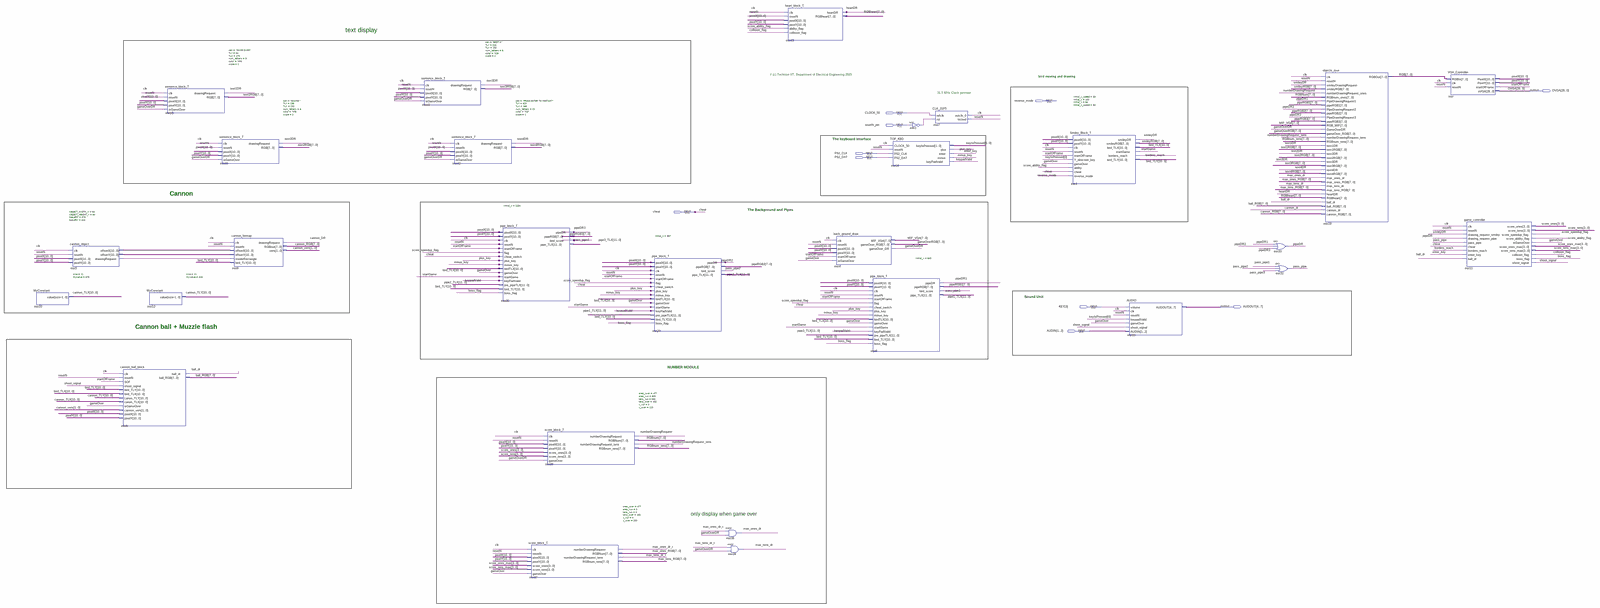
[diagram p0: schematic sheet, whole]
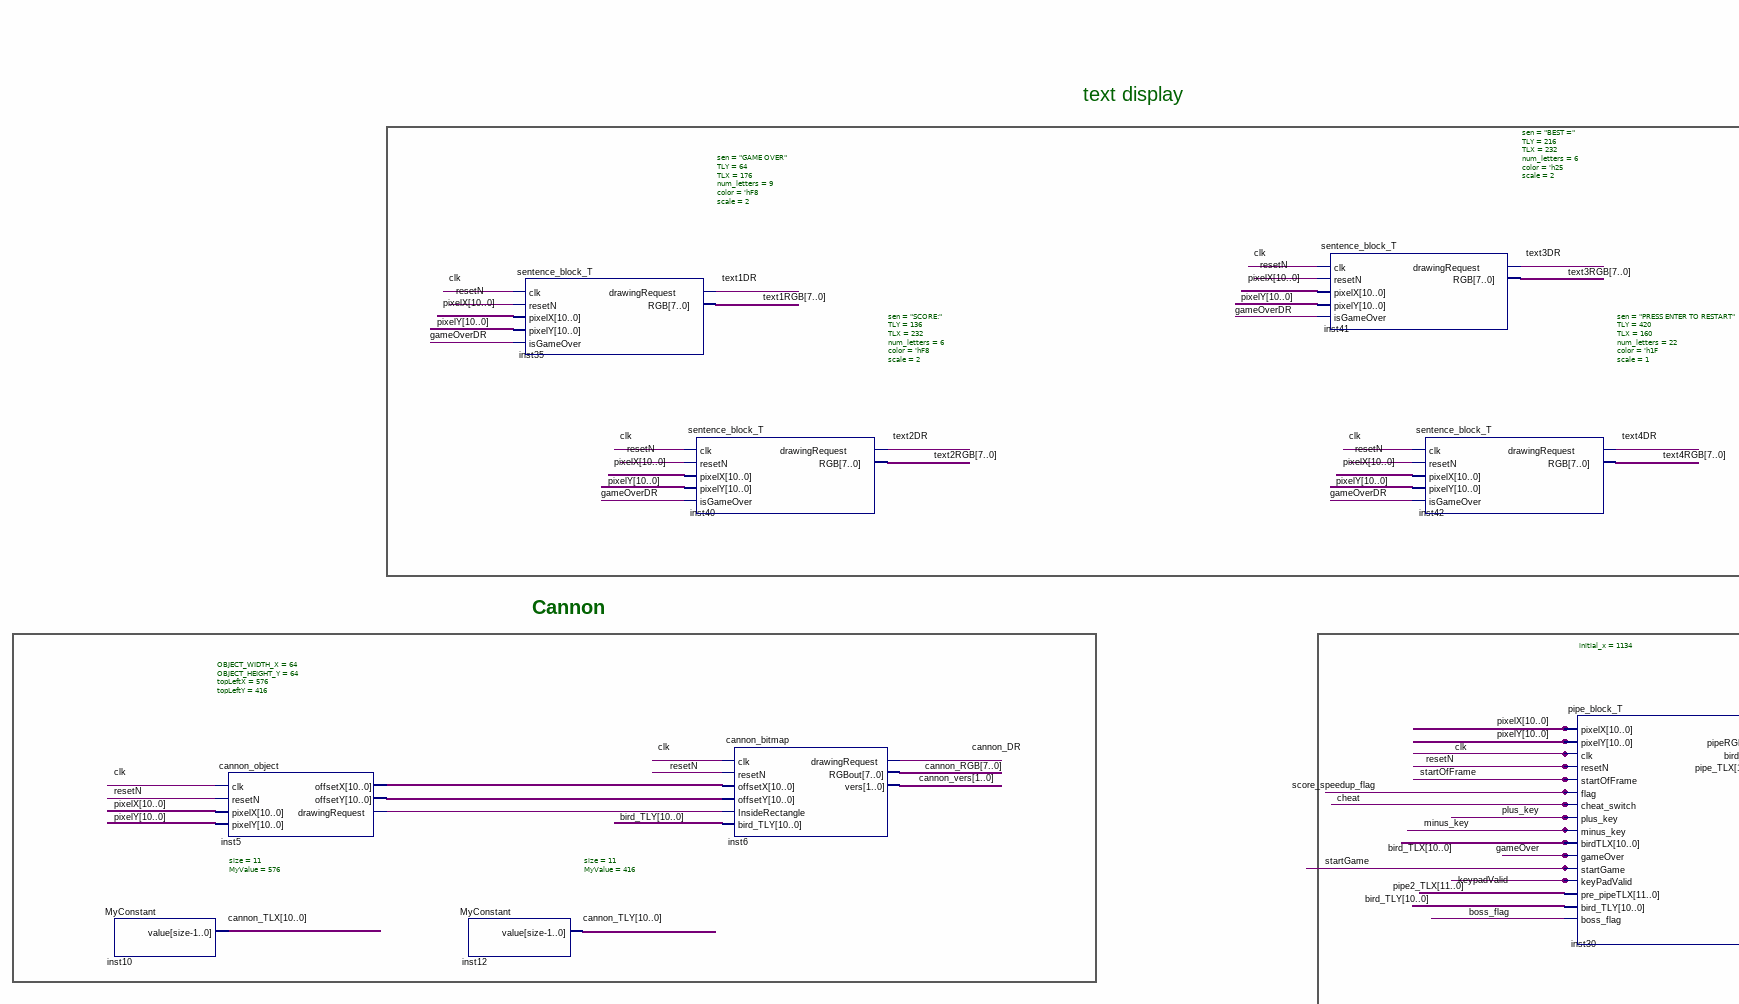
[diagram p1: schematic sheet, upper left part]
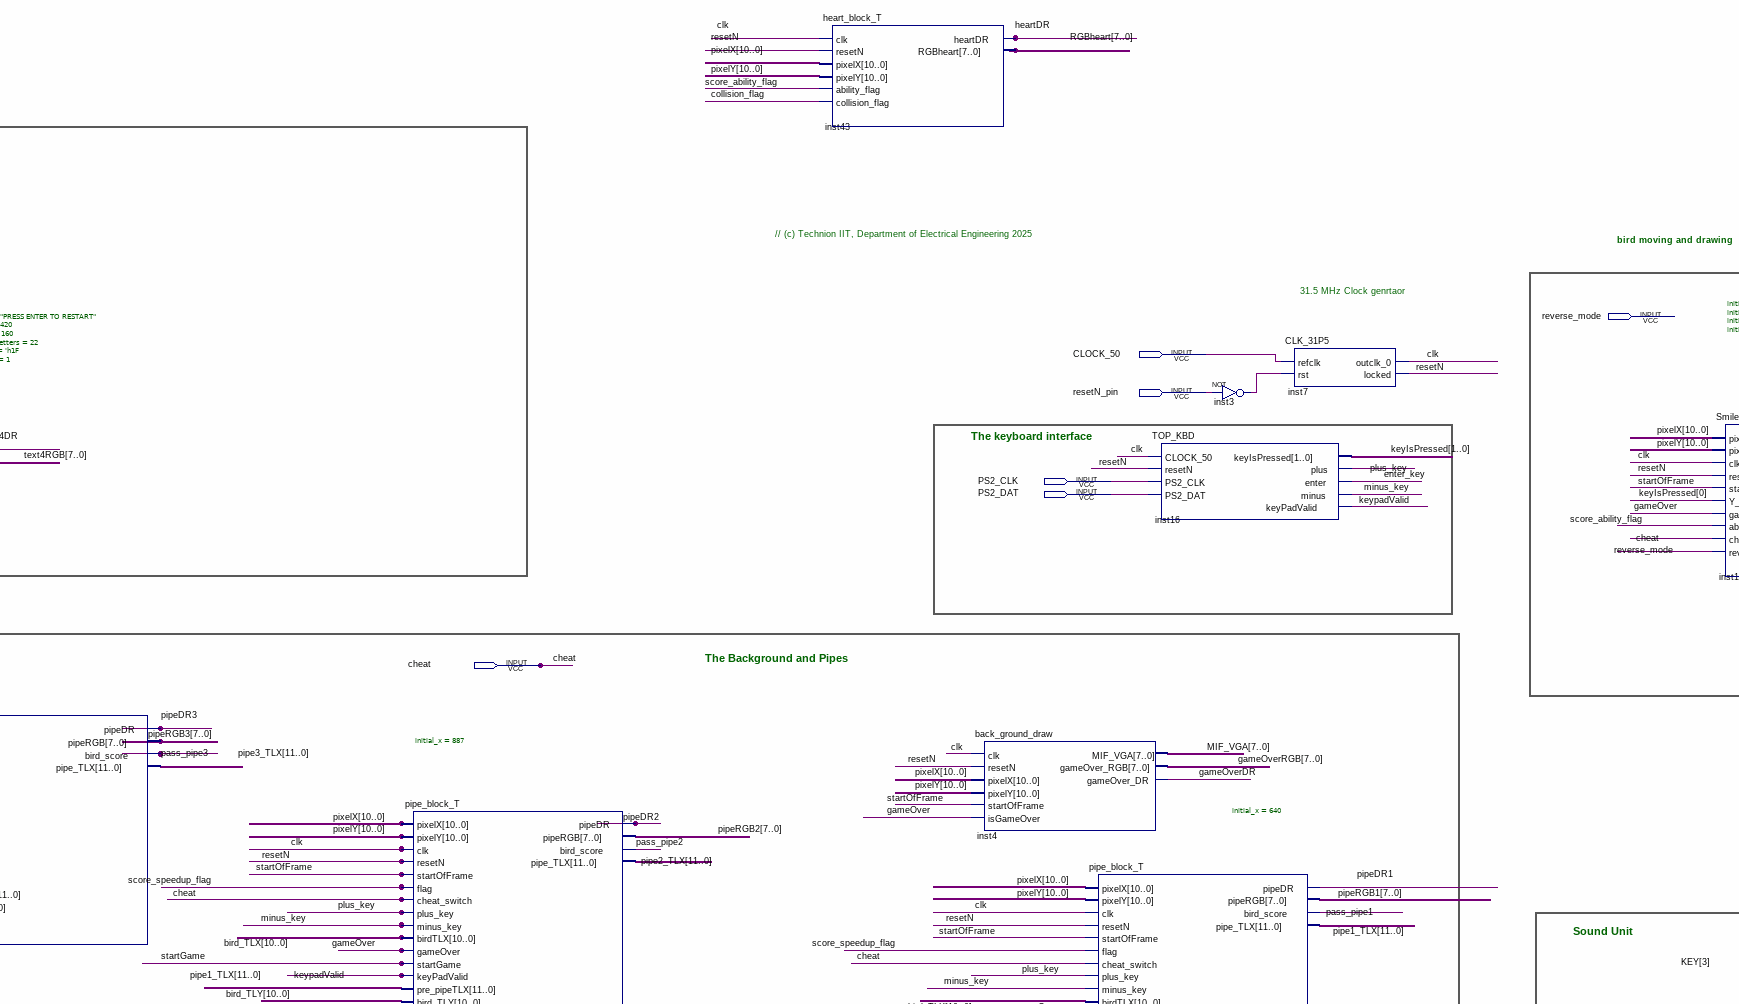
[diagram p2: schematic sheet, upper centre part]
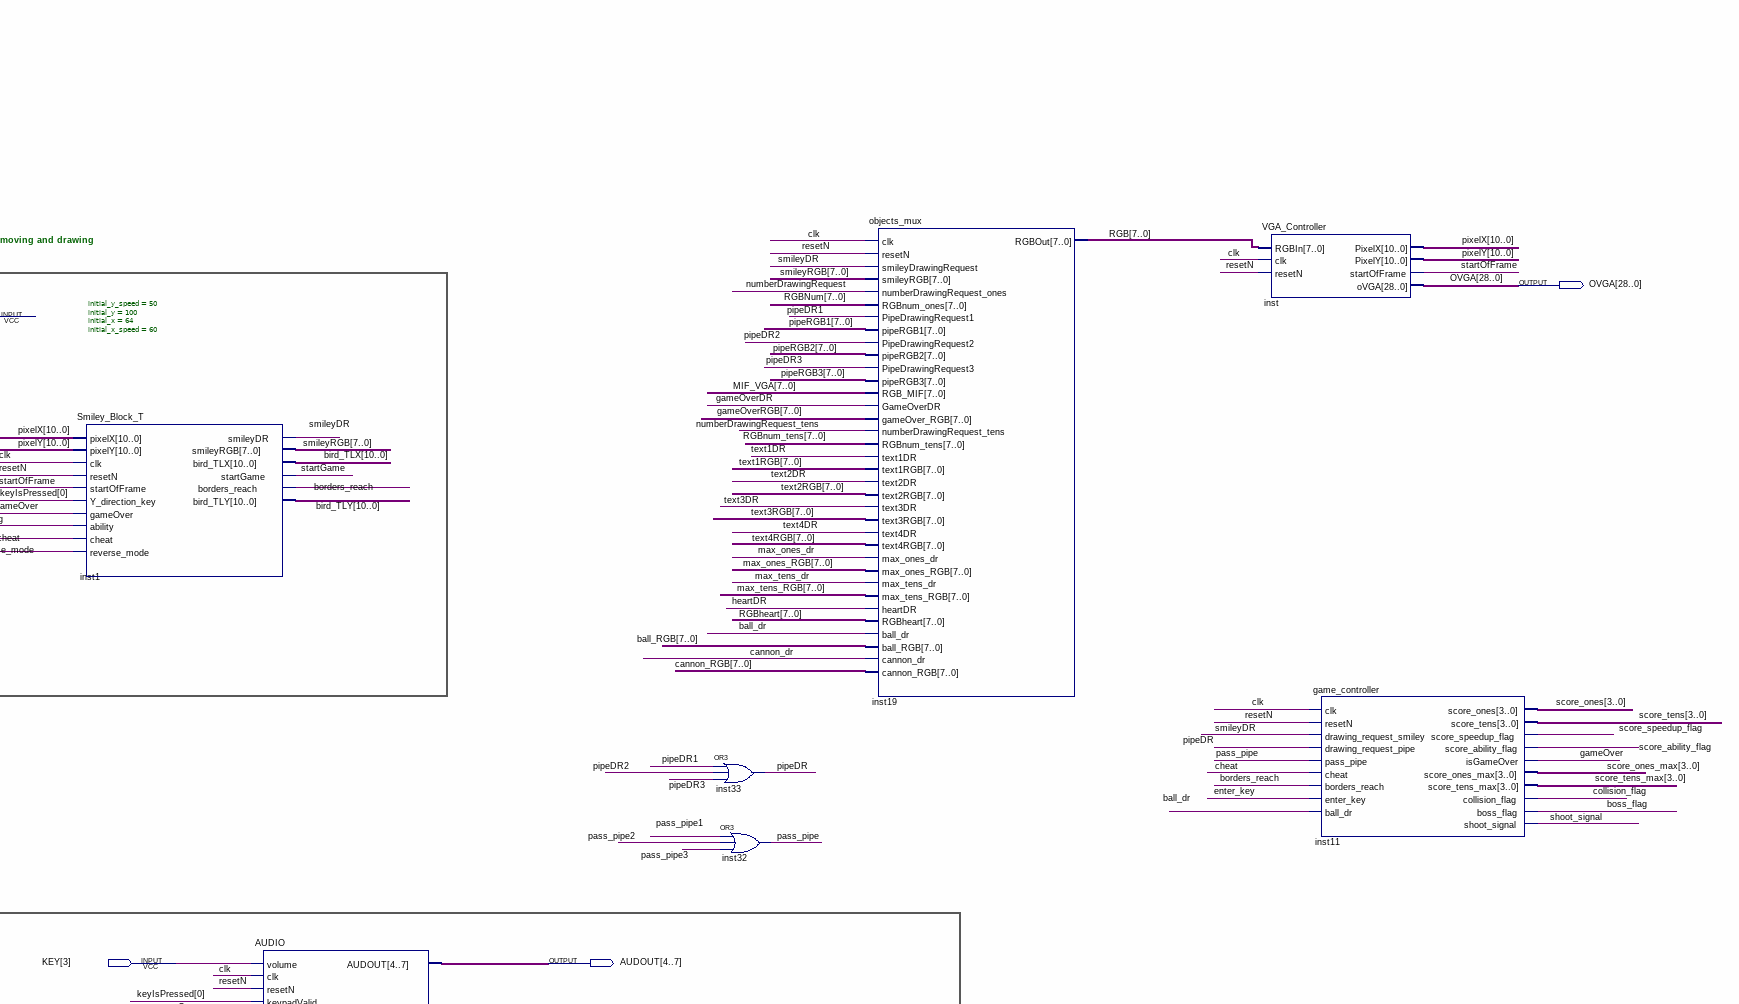
[diagram p3: schematic sheet, upper right part]
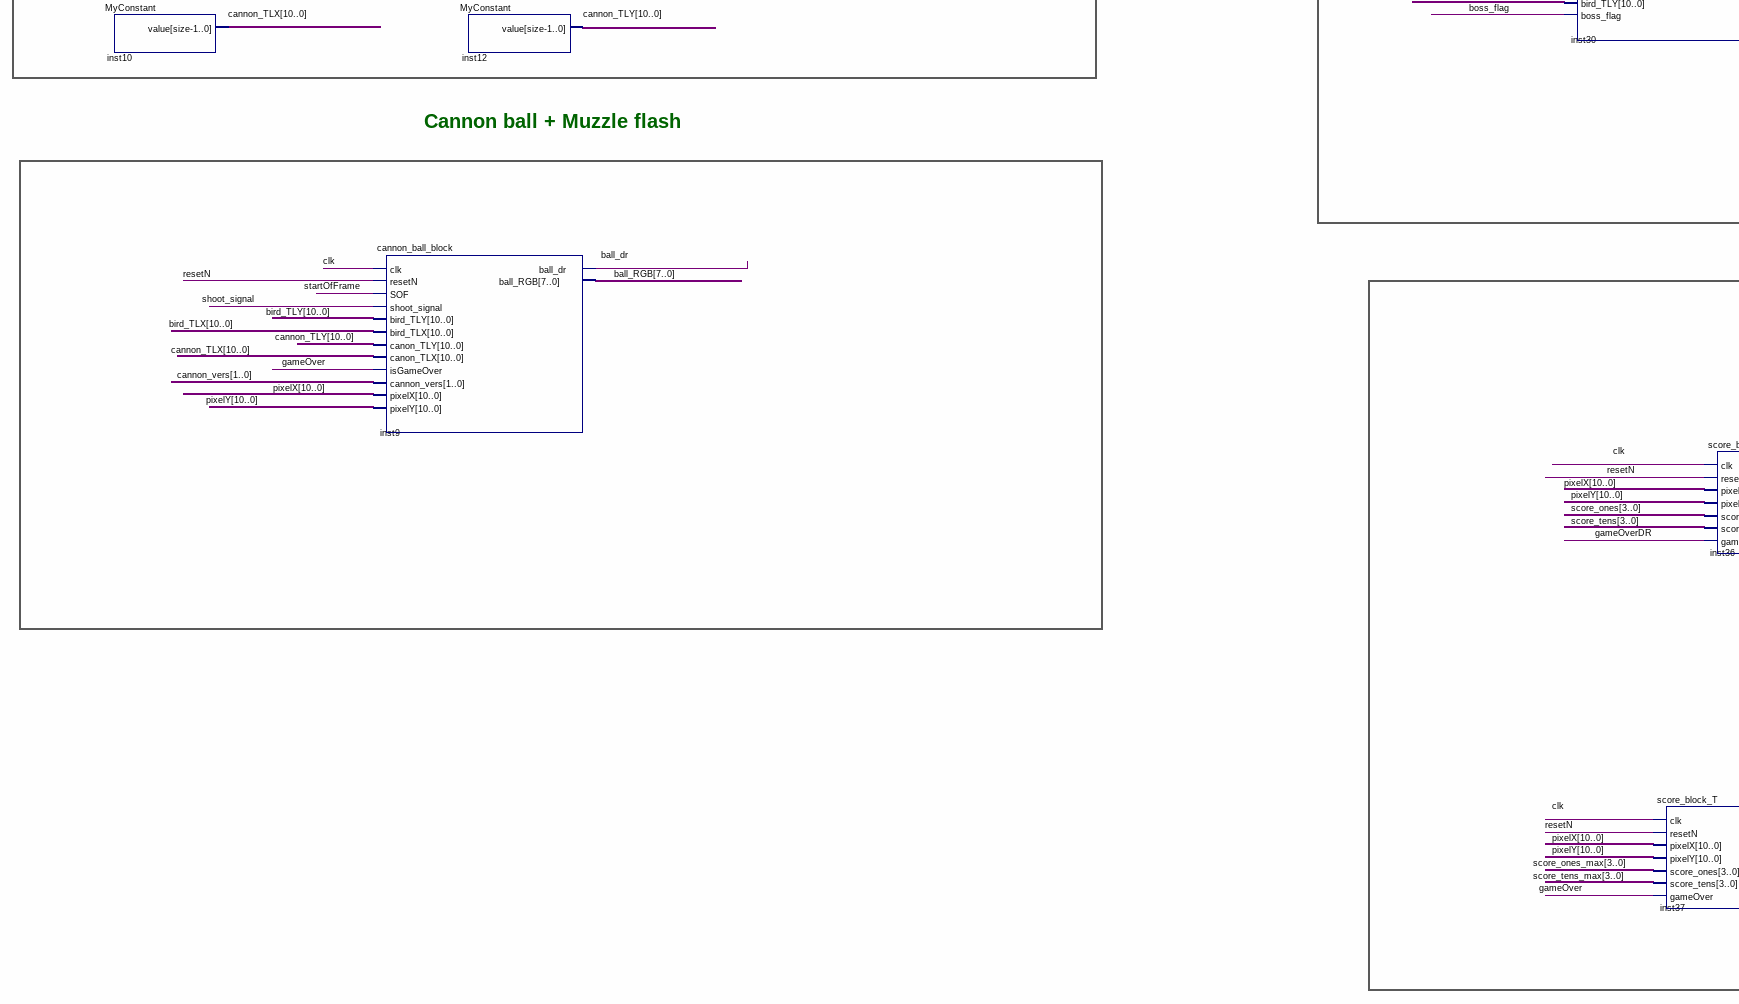
[diagram p4: schematic sheet, lower left part]
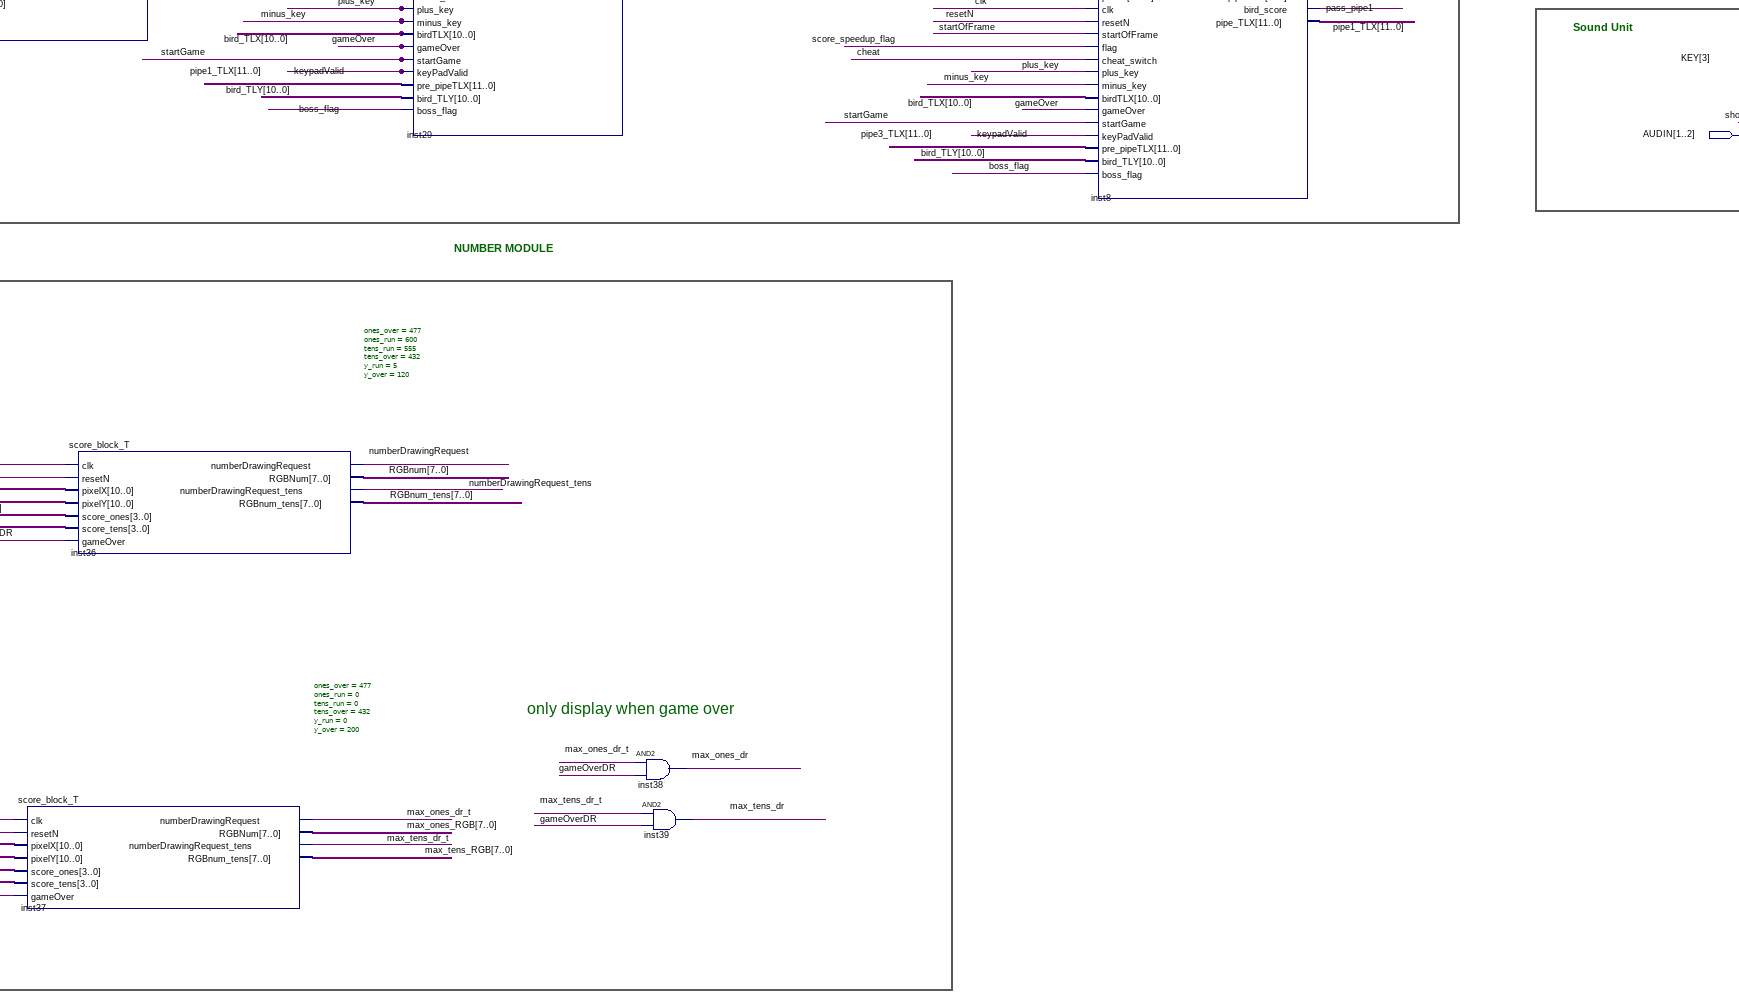
[diagram p5: schematic sheet, lower centre part]
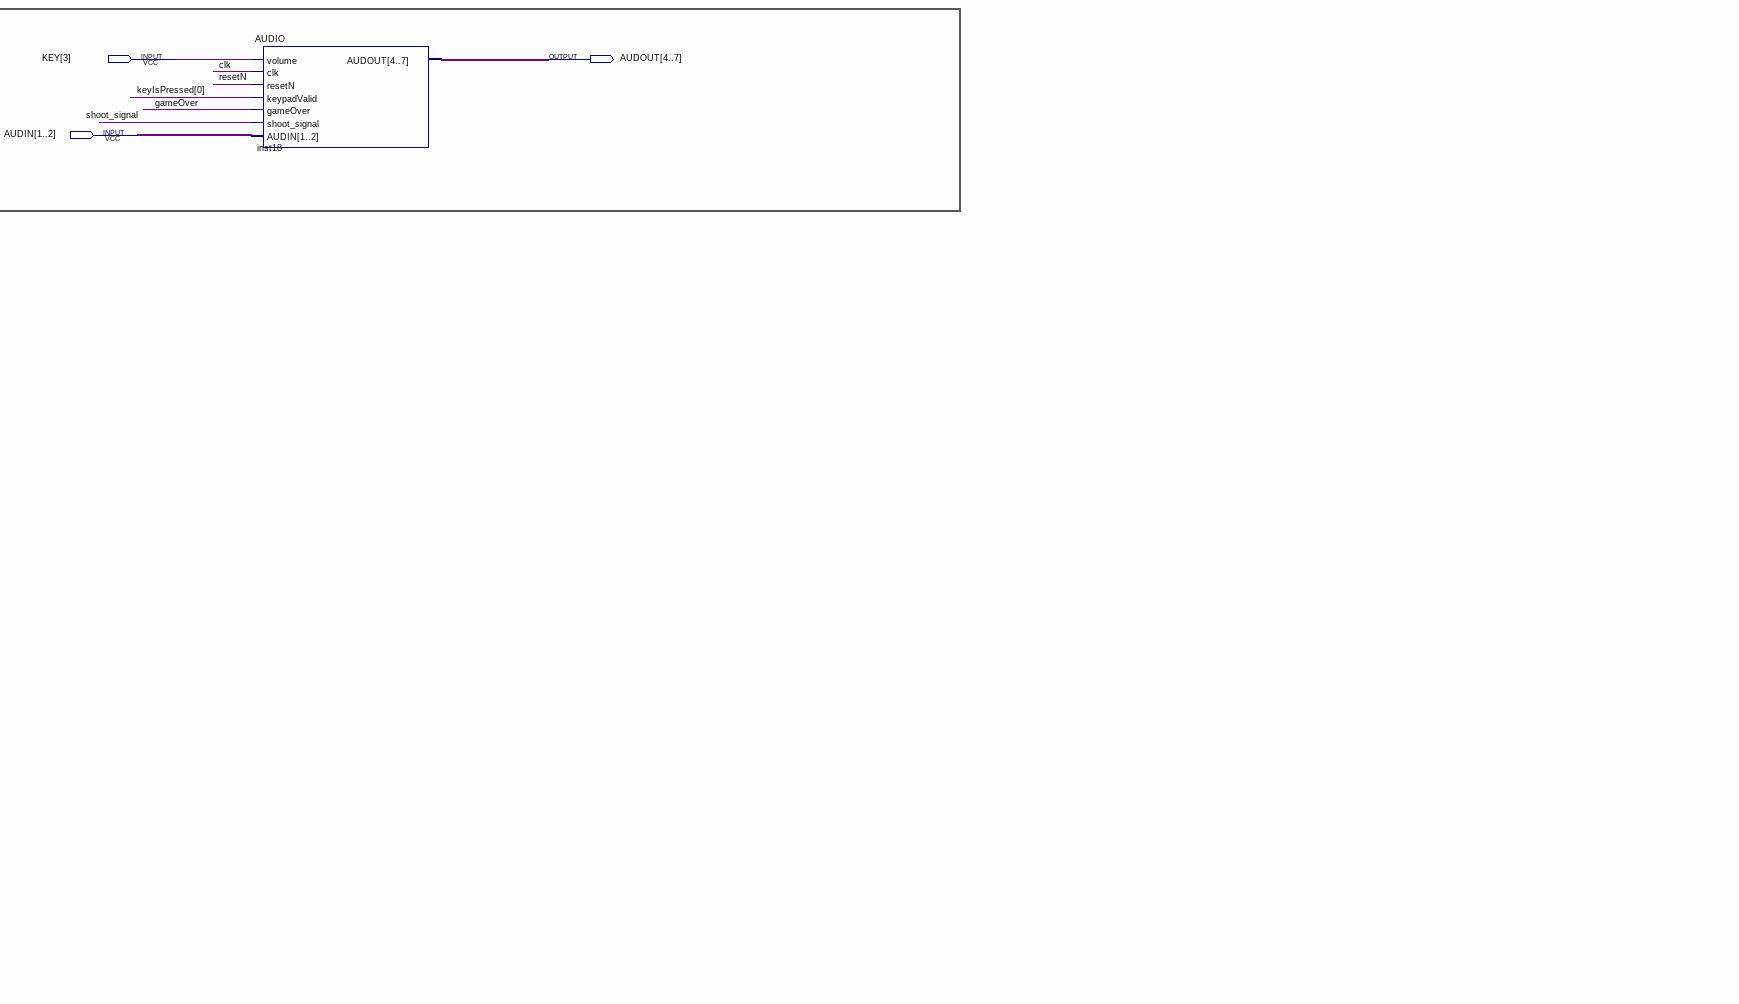
[diagram p6: schematic sheet, lower right part]
// Quartus schematic TOP_VGA_DEMO.bdf as structural Verilog: 28 symbols, 10 pins
module TOP_VGA_DEMO (
  input  reverse_mode,
  input  CLOCK_50,
  input  resetN_pin,
  input  PS2_CLK,
  input  PS2_DAT,
  input  cheat,
  input  [3:3] KEY,
  input  [1:2] AUDIN,
  output [28:0] OVGA,
  output [4:7] AUDOUT
);

  wire ball_dr, borders_reach, boss_flag, cannon_DR, clk, collision_flag, enter_key, gameOver, gameOverDR,
       heartDR, inst3_out, inst5_drawingrequest, keypadValid, max_ones_dr, max_ones_dr_t, max_tens_dr,
       max_tens_dr_t, minus_key, numberDrawingRequest, numberDrawingRequest_tens, pass_pipe, pass_pipe1,
       pass_pipe2, pass_pipe3, pipeDR, pipeDR1, pipeDR2, pipeDR3, plus_key, resetN, score_ability_flag,
       score_speedup_flag, shoot_signal, smileyDR, startGame, startOfFrame, text1DR, text2DR, text3DR,
       text4DR;
  wire [1:0] cannon_vers, keyIsPressed;
  wire [3:0] score_ones, score_ones_max, score_tens, score_tens_max;
  wire [7:0] ball_RGB, cannon_RGB, gameOverRGB, max_ones_RGB, max_tens_RGB, MIF_VGA, pipeRGB1, pipeRGB2,
       pipeRGB3, RGB, RGBheart, RGBnum, RGBnum_tens, smileyRGB, text1RGB, text2RGB, text3RGB, text4RGB;
  wire [10:0] bird_TLX, bird_TLY, cannon_TLX, cannon_TLY, inst5_offsetx, inst5_offsety, pixelX, pixelY;
  wire [11:0] pipe1_TLX, pipe2_TLX, pipe3_TLX;

  MyConstant #(.size(11), .MyValue(576)) inst10 (.value(cannon_TLX));
  cannon_object #(.OBJECT_WIDTH_X(64), .OBJECT_HEIGHT_Y(64), .topLeftX(576), .topLeftY(416)) inst5 (
    .clk(clk), .resetN(resetN), .pixelX(pixelX), .pixelY(pixelY), .offsetX(inst5_offsetx),
    .offsetY(inst5_offsety), .drawingRequest(inst5_drawingrequest));
  cannon_ball_block inst9 (
    .clk(clk), .resetN(resetN), .SOF(startOfFrame), .shoot_signal(shoot_signal), .bird_TLY(bird_TLY),
    .bird_TLX(bird_TLX), .canon_TLY(cannon_TLY), .canon_TLX(cannon_TLX), .isGameOver(gameOver),
    .cannon_vers(cannon_vers), .pixelX(pixelX), .pixelY(pixelY), .ball_dr(ball_dr), .ball_RGB(ball_RGB));
  MyConstant #(.size(11), .MyValue(416)) inst12 (.value(cannon_TLY));
  sentence_block_T #(.sen("GAME OVER"), .TLY(64), .TLX(176), .num_letters(9), .color('hF8), .scale(2)) inst35 (
    .clk(clk), .resetN(resetN), .pixelX(pixelX), .pixelY(pixelY), .isGameOver(gameOverDR),
    .drawingRequest(text1DR), .RGB(text1RGB));
  sentence_block_T #(.sen("SCORE:"), .TLY(136), .TLX(232), .num_letters(6), .color('hF8), .scale(2)) inst40 (
    .clk(clk), .resetN(resetN), .pixelX(pixelX), .pixelY(pixelY), .isGameOver(gameOverDR),
    .drawingRequest(text2DR), .RGB(text2RGB));
  cannon_bitmap inst6 (
    .clk(clk), .resetN(resetN), .offsetX(inst5_offsetx), .offsetY(inst5_offsety),
    .InsideRectangle(inst5_drawingrequest), .bird_TLY(bird_TLY), .drawingRequest(cannon_DR),
    .RGBout(cannon_RGB), .vers(cannon_vers));
  sentence_block_T #(.sen("BEST ="), .TLY(216), .TLX(232), .num_letters(6), .color('h25), .scale(2)) inst41 (
    .clk(clk), .resetN(resetN), .pixelX(pixelX), .pixelY(pixelY), .isGameOver(gameOverDR),
    .drawingRequest(text3DR), .RGB(text3RGB));
  sentence_block_T #(.sen("PRESS ENTER TO RESTART"), .TLY(420), .TLX(160), .num_letters(22), .color('h1F), .scale(1)) inst42 (
    .clk(clk), .resetN(resetN), .pixelX(pixelX), .pixelY(pixelY), .isGameOver(gameOverDR),
    .drawingRequest(text4DR), .RGB(text4RGB));
  pipe_block_T #(.initial_x(1134)) inst30 (
    .pixelX(pixelX), .pixelY(pixelY), .clk(clk), .resetN(resetN), .startOfFrame(startOfFrame),
    .flag(score_speedup_flag), .cheat_switch(cheat), .plus_key(plus_key), .minus_key(minus_key),
    .birdTLX(bird_TLX), .gameOver(gameOver), .startGame(startGame), .keyPadValid(keypadValid),
    .pre_pipeTLX(pipe2_TLX), .bird_TLY(bird_TLY), .boss_flag(boss_flag), .pipeDR(pipeDR3),
    .pipeRGB(pipeRGB3), .bird_score(pass_pipe3), .pipe_TLX(pipe3_TLX));
  score_block_T #(.ones_over(477), .ones_run(0), .tens_run(0), .tens_over(432), .y_run(0), .y_over(200)) inst37 (
    .clk(clk), .resetN(resetN), .pixelX(pixelX), .pixelY(pixelY), .score_ones(score_ones_max),
    .score_tens(score_tens_max), .gameOver(gameOver), .numberDrawingRequest(max_ones_dr_t),
    .RGBNum(max_ones_RGB), .numberDrawingRequest_tens(max_tens_dr_t), .RGBnum_tens(max_tens_RGB));
  score_block_T #(.ones_over(477), .ones_run(600), .tens_run(555), .tens_over(432), .y_run(5), .y_over(120)) inst36 (
    .clk(clk), .resetN(resetN), .pixelX(pixelX), .pixelY(pixelY), .score_ones(score_ones),
    .score_tens(score_tens), .gameOver(gameOverDR), .numberDrawingRequest(numberDrawingRequest),
    .RGBNum(RGBnum), .numberDrawingRequest_tens(numberDrawingRequest_tens), .RGBnum_tens(RGBnum_tens));
  pipe_block_T #(.initial_x(887)) inst29 (
    .pixelX(pixelX), .pixelY(pixelY), .clk(clk), .resetN(resetN), .startOfFrame(startOfFrame),
    .flag(score_speedup_flag), .cheat_switch(cheat), .plus_key(plus_key), .minus_key(minus_key),
    .birdTLX(bird_TLX), .gameOver(gameOver), .startGame(startGame), .keyPadValid(keypadValid),
    .pre_pipeTLX(pipe1_TLX), .bird_TLY(bird_TLY), .boss_flag(boss_flag), .pipeDR(pipeDR2),
    .pipeRGB(pipeRGB2), .bird_score(pass_pipe2), .pipe_TLX(pipe2_TLX));
  and inst38 (max_ones_dr, max_ones_dr_t, gameOverDR);
  and inst39 (max_tens_dr, max_tens_dr_t, gameOverDR);
  heart_block_T inst43 (
    .clk(clk), .resetN(resetN), .pixelX(pixelX), .pixelY(pixelY), .ability_flag(score_ability_flag),
    .collision_flag(collision_flag), .heartDR(heartDR), .RGBheart(RGBheart));
  back_ground_draw inst4 (
    .clk(clk), .resetN(resetN), .pixelX(pixelX), .pixelY(pixelY), .startOfFrame(startOfFrame),
    .isGameOver(gameOver), .MIF_VGA(MIF_VGA), .gameOver_RGB(gameOverRGB), .gameOver_DR(gameOverDR));
  pipe_block_T #(.initial_x(640)) inst8 (
    .pixelX(pixelX), .pixelY(pixelY), .clk(clk), .resetN(resetN), .startOfFrame(startOfFrame),
    .flag(score_speedup_flag), .cheat_switch(cheat), .plus_key(plus_key), .minus_key(minus_key),
    .birdTLX(bird_TLX), .gameOver(gameOver), .startGame(startGame), .keyPadValid(keypadValid),
    .pre_pipeTLX(pipe3_TLX), .bird_TLY(bird_TLY), .boss_flag(boss_flag), .pipeDR(pipeDR1),
    .pipeRGB(pipeRGB1), .bird_score(pass_pipe1), .pipe_TLX(pipe1_TLX));
  TOP_KBD inst16 (
    .CLOCK_50(clk), .resetN(resetN), .PS2_CLK(PS2_CLK), .PS2_DAT(PS2_DAT), .keyIsPressed(keyIsPressed),
    .plus(plus_key), .enter(enter_key), .minus(minus_key), .keyPadValid(keypadValid));
  not inst3 (inst3_out, resetN_pin);
  CLK_31P5 inst7 (.refclk(CLOCK_50), .rst(inst3_out), .outclk_0(clk), .locked(resetN));
  Smiley_Block_T #(.initial_y_speed(50), .initial_y(100), .initial_x(64), .initial_x_speed(60)) inst1 (
    .pixelX(pixelX), .pixelY(pixelY), .clk(clk), .resetN(resetN), .startOfFrame(startOfFrame),
    .Y_direction_key(keyIsPressed[0]), .gameOver(gameOver), .ability(score_ability_flag), .cheat(cheat),
    .reverse_mode(reverse_mode), .smileyDR(smileyDR), .smileyRGB(smileyRGB), .bird_TLX(bird_TLX),
    .startGame(startGame), .borders_reach(borders_reach), .bird_TLY(bird_TLY));
  AUDIO inst18 (
    .volume(KEY[3]), .clk(clk), .resetN(resetN), .keypadValid(keyIsPressed[0]), .gameOver(gameOver),
    .shoot_signal(shoot_signal), .AUDIN(AUDIN), .AUDOUT(AUDOUT));
  or inst33 (pipeDR, pipeDR1, pipeDR2, pipeDR3);
  or inst32 (pass_pipe, pass_pipe1, pass_pipe2, pass_pipe3);
  objects_mux inst19 (
    .clk(clk), .resetN(resetN), .smileyDrawingRequest(smileyDR), .smileyRGB(smileyRGB),
    .numberDrawingRequest_ones(numberDrawingRequest), .RGBnum_ones(RGBnum), .PipeDrawingRequest1(pipeDR1),
    .pipeRGB1(pipeRGB1), .PipeDrawingRequest2(pipeDR2), .pipeRGB2(pipeRGB2), .PipeDrawingRequest3(pipeDR3),
    .pipeRGB3(pipeRGB3), .RGB_MIF(MIF_VGA), .GameOverDR(gameOverDR), .gameOver_RGB(gameOverRGB),
    .numberDrawingRequest_tens(numberDrawingRequest_tens), .RGBnum_tens(RGBnum_tens), .text1DR(text1DR),
    .text1RGB(text1RGB), .text2DR(text2DR), .text2RGB(text2RGB), .text3DR(text3DR), .text3RGB(text3RGB),
    .text4DR(text4DR), .text4RGB(text4RGB), .max_ones_dr(max_ones_dr), .max_ones_RGB(max_ones_RGB),
    .max_tens_dr(max_tens_dr), .max_tens_RGB(max_tens_RGB), .heartDR(heartDR), .RGBheart(RGBheart),
    .ball_dr(ball_dr), .ball_RGB(ball_RGB), .cannon_dr(cannon_DR), .cannon_RGB(cannon_RGB), .RGBOut(RGB));
  VGA_Controller inst (
    .RGBIn(RGB), .clk(clk), .resetN(resetN), .PixelX(pixelX), .PixelY(pixelY), .startOfFrame(startOfFrame),
    .oVGA(OVGA));
  game_controller inst11 (
    .clk(clk), .resetN(resetN), .drawing_request_smiley(smileyDR), .drawing_request_pipe(pipeDR),
    .pass_pipe(pass_pipe), .cheat(cheat), .borders_reach(borders_reach), .enter_key(enter_key),
    .ball_dr(ball_dr), .score_ones(score_ones), .score_tens(score_tens),
    .score_speedup_flag(score_speedup_flag), .score_ability_flag(score_ability_flag), .isGameOver(gameOver),
    .score_ones_max(score_ones_max), .score_tens_max(score_tens_max), .collision_flag(collision_flag),
    .boss_flag(boss_flag), .shoot_signal(shoot_signal));

  // Notes on the sheet:
  //   text display
  //   // (c) Technion IIT, Department of Electrical Engineering 2025
  //   bird moving and drawing
  //   31.5 MHz Clock genrtaor
  //   The keyboard interface
  //   Cannon
  //   The Background and Pipes
  //   Sound Unit
  //   Cannon ball + Muzzle flash
  //    NUMBER MODULE
  //   only display when game over
endmodule
